# Altium schematic sheet MB1379.SchDoc: Camera Module :HDF5640-AF-V2.0
size A4; Date: Not used; ApprovedBy: Not used; CheckedBy: Not used; Author: Not used; CompanyName: STMicroelectronics; DrawnBy: Not used; Engineer: Not used; Organization: Not used; Address1: Not used; Address2: Not used; Address3: Not used; Address4: Not used; DocumentNumber: Not used; Revision: Not used; SheetNumber: 2; SheetTotal: 2; CurrentTime: Not used; CurrentDate: Not used; Time: Not used; DocumentFullPathAndName: Not used; DocumentName: Not used; ModifiedDate: Not used; ImagePath: Not used; ProjectName: MB1379; Application_BuildNumber: Not used
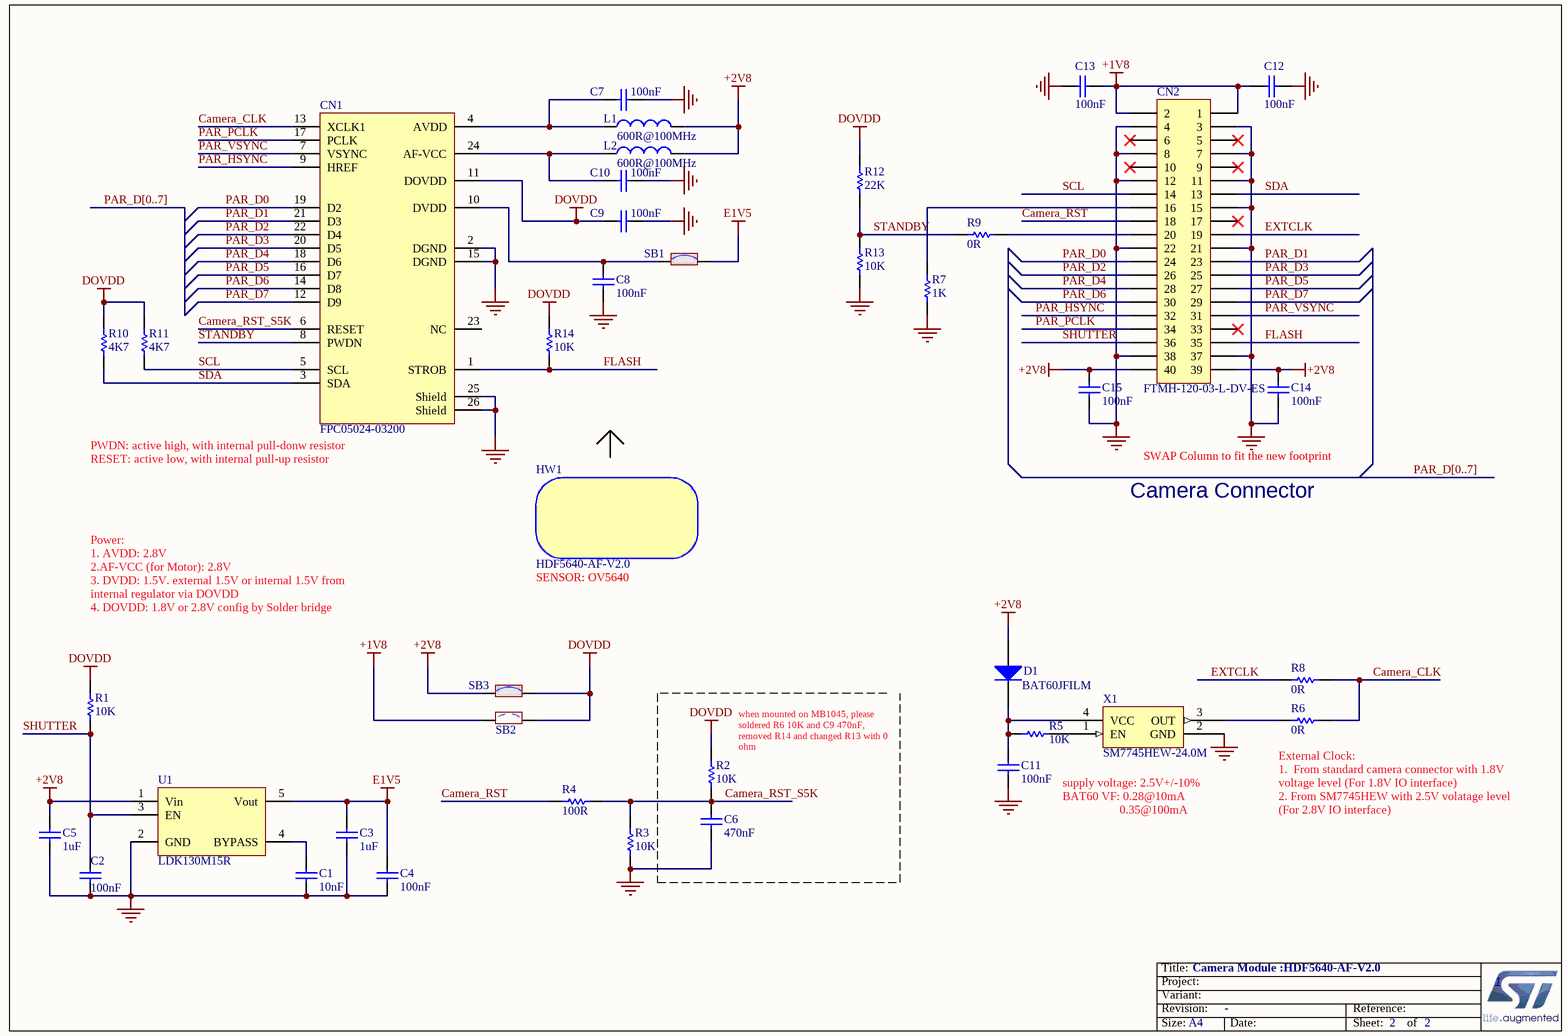
[diagram p0: MB1379.SchDoc]

## Parts
C1  value 10nF  [C0603]  (hidden comment: Capacitor)
C2  value 100nF  [C0603]  (hidden comment: Capacitor)
C3  value 1uF  [C0603]  (hidden comment: Capacitor)
C4  value 100nF  [C0603]  (hidden comment: Capacitor)
C5  value 1uF  [C0603]  (hidden comment: Capacitor)
C6  value 470nF  [C0603]  (hidden comment: Capacitor)
C7  value 100nF  [C0603]  (hidden comment: Capacitor)
C8  value 100nF  [C0603]  (hidden comment: Capacitor)
C9  value 100nF  [C0603]  (hidden comment: Capacitor)
C10  value 100nF  [C0603]  (hidden comment: Capacitor)
C11  value 100nF  [C0603]  (hidden comment: Capacitor)
C12  value 100nF  [C0603]  (hidden comment: Capacitor)
C13  value 100nF  [C0603]  (hidden comment: Capacitor)
C14  value 100nF  [C0603]  (hidden comment: Capacitor)
C15  value 100nF  [C0603]  (hidden comment: Capacitor)
CN1  FPC05024-03200  [CON_ATOM_FPC05024-03200]
CN2  value FTMH-120-03-L-DV-ES  [CON_SAMTEC_FTMH-120-03-L-DV-ES]  (hidden comment: Header 20x2)
D1  BAT60JFILM  [DIO_SOD323]
HW1  value HDF5640-AF-V2.0  (hidden comment: Camera_Module)
L1  value 600R@100MHz  [L0603]  (hidden comment: BEAD)
L2  value 600R@100MHz  [L0603]  (hidden comment: BEAD)
R1  value 10K  [R0603]  (hidden comment: Resistor)
R2  value 10K  [R0603]  (hidden comment: Resistor)
R3  value 10K  [R0603]  (hidden comment: Resistor)
R4  value 100R  [R0603]  (hidden comment: Resistor)
R5  value 10K  [R0603]  (hidden comment: Resistor)
R6  value 0R  [R0603]  (hidden comment: Resistor)
R7  value 1K  [R0603]  (hidden comment: Resistor)
R8  value 0R  [R0603]  (hidden comment: Resistor)
R9  value 0R  [R0603]  (hidden comment: Resistor)
R10  value 4K7  [R0603]  (hidden comment: Resistor)
R11  value 4K7  [R0603]  (hidden comment: Resistor)
R12  value 22K  [R0603]  (hidden comment: Resistor)
R13  value 10K  [R0603]  (hidden comment: Resistor)
R14  value 10K  [R0603]  (hidden comment: Resistor)
SB1  SB_ON  [SOLDER-BRIDGE_R0603-0R]  (value not drawn)
SB2  SB_OFF  [SOLDER-BRIDGE_R0603-0R]  (value not drawn)
SB3  SB_ON  [SOLDER-BRIDGE_R0603-0R]  (value not drawn)
U1  LDK130M15R  [REG_SOT23-5L]
X1  value SM7745HEW-24.0M  [OSC_PLE_SM77H-SERIES_7X5_H1P73_4P]  (hidden comment: SM7745HEV-24.0M)

## Nets
+1V8: C12.1 C13.2 CN2.1 CN2.2 SB2.1
+2V8: C5.2 C14.2 C15.2 CN2.39 CN2.40 D1.1(A) L1.2 L2.2 SB3.1 U1.1(Vin)
DOVDD: C9.1 CN1.11(DOVDD) R1.2 R2.2 R10.1 R11.1 R12.2 R14.2 SB2.2 SB3.2
E1V5: C3.2 C4.2 SB1.2 U1.5(Vout)
GND: C1.1 C2.1 C3.1 C4.1 C5.1 C6.1 C7.2 C8.1 C9.2 C10.2 C11.1 C12.2 C13.1 C14.1 C15.1 CN1.2(DGND) CN1.15(DGND) CN1.25(Shield) CN1.26(Shield) CN2.3 CN2.4 CN2.7 CN2.8 CN2.11 CN2.12 CN2.15 CN2.21 CN2.22 CN2.37 CN2.38 R3.1 R7.2 R13.1 U1.2(GND) X1.2(GND)
Camera_CLK: CN1.13(XCLK1) R6.2 R8.2
Camera_RST: CN2.18 R4.1
Camera_RST_S5K: C6.2 CN1.6(RESET) R2.1 R3.2 R4.2
EXTCLK: CN2.19 R8.1
FLASH: CN1.1(STROB) CN2.35 R14.1
PAR_D0: CN1.19(D2) CN2.24
PAR_D1: CN1.21(D3) CN2.23
PAR_D2: CN1.22(D4) CN2.26
PAR_D3: CN1.20(D5) CN2.25
PAR_D4: CN1.18(D6) CN2.28
PAR_D5: CN1.16(D7) CN2.27
PAR_D6: CN1.14(D8) CN2.30
PAR_D7: CN1.12(D9) CN2.29
PAR_HSYNC: CN1.9(HREF) CN2.32
PAR_PCLK: CN1.17(PCLK) CN2.34
PAR_VSYNC: CN1.7(VSYNC) CN2.31
SCL: CN1.5(SCL) CN2.14 R11.2
SDA: CN1.3(SDA) CN2.13 R10.2
SHUTTER: C2.2 CN2.36 R1.1 U1.3(EN)
STANDBY: CN1.8(PWDN) R9.1 R12.1 R13.2
NetC1_2: C1.2 U1.4(BYPASS)
NetC7_1: C7.1 CN1.4(AVDD) L1.1
NetC8_2: C8.2 CN1.10(DVDD) SB1.1
NetC10_1: C10.1 CN1.24(AF-VCC) L2.1
NetC11_2: C11.2 D1.2(K) R5.2 X1.4(VCC)
NetCN2_16: CN2.16 R7.1
NetCN2_20: CN2.20 R9.2
NetR5_1: R5.1 X1.1(EN)
NetR6_1: R6.1 X1.3(OUT)

Not connected (* = marked no-connect by the designer): CN1 23(NC); CN2 5* 6* 9* 10* 17* 33*

## Buses and harness runs
bus PAR_D[0..7]

## Notes on the sheet
- (near CN1) PWDN: active high, with internal pull-donw resistor
  RESET: active low, with internal pull-up resistor
- Camera Connector
- SWAP Column to fit the new footprint
- SENSOR: OV5640
- Power:
  1. AVDD: 2.8V
  2.AF-VCC (for Motor): 2.8V
  3. DVDD: 1.5V. external 1.5V or internal 1.5V from internal regulator via DOVDD
  4. DOVDD: 1.8V or 2.8V config by Solder bridge
- (near R2) when mounted on MB1045, please soldered R6 10K and C9 470nF, removed R14 and changed R13 with 0 ohm
- supply voltage: 2.5V+/-10%
  BAT60 VF: 0.28@10mA
  0.35@100mA
- (near R6) External Clock:
  1.  From standard camera connector with 1.8V voltage level (For 1.8V IO interface)
  2. From SM7745HEW with 2.5V volatage level (For 2.8V IO interface)
- 1
- Title:
- Project:
- Size:
- Revision:
- Variant:
- A4
- -
- Date:
- Reference:
- Sheet:
- of

## Library data of the parts
C1 = MCD-01007: Capacitor, MLCC, 10nF, 16V, X7R, 10%, 0603, T=0.8mm; Manufacturer_Part_Number: CC0603KRX7R7BB103; Manufacturer: YAGEO; Provided_By: SUBCO; Internal_Part_Number: MCD-01007; ECCN_US: N/A; ECCN_EU: N/A; ComponentLink1Description: Datasheet; Status: Released; Part_Type: Capacitor; Package: C0603; ComponentLink1URL: http://tunmcdsvn.tun.st.com/Component_Datasheet_Library/Trunk/Capacitors/Yageo_Multilayer_Capacitor_X7R_series_100pF_to_22uF/
C2 C4 C7-C15 = MCD-00211: Capacitor, MLCC, 100nF, 16V, X7R, 10%, 0603, T=0,8mm; Manufacturer_Part_Number: CC0603KRX7R7BB104; Manufacturer: YAGEO; ECCN_US: EAR99; ECCN_EU: NEC; Provided_By: SUBCO; Internal_Part_Number: MCD-00211; ComponentLink1Description: Datasheet; Status: Released; Part_Type: Capacitor; Package: C0603; ComponentLink1URL: http://tunmcdsvn.tun.st.com/Component_Datasheet_Library/Trunk/Capacitors/Yageo_Multilayer_Capacitor_X7R_series_100pF_to_22uF
C3 C5 = MCD-00010: Capacitor, MLCC, 1uF, 16V, X5R, 10%, 0603, T=0,8mm; Manufacturer_Part_Number: CC0603KRX5R7BB105; Manufacturer: YAGEO; ECCN_US: EAR99; ECCN_EU: NEC; Provided_By: SUBCO; Internal_Part_Number: MCD-00010; ComponentLink1Description: Datasheet; Status: Released; Part_Type: Capacitor; Package: C0603; ComponentLink1URL: http://tunmcdsvn.tun.st.com/Component_Datasheet_Library/Trunk/Capacitors/Yageo_Multilayer_capacitor_X5R_series_100pF_to_100uF
C6 = MCD-01006: Capacitor, MLCC, 470nF, 16V, X7R, 10%, 0603, T=0.8mm; Manufacturer_Part_Number: CC0603KRX7R7BB474; Manufacturer: YAGEO; Provided_By: SUBCO; Internal_Part_Number: MCD-01006; Status: Released; Part_Type: Capacitor; Package: C0603; ComponentLink1Description: Datasheet; ComponentLink1URL: http://tunmcdsvn.tun.st.com/Component_Datasheet_Library/Trunk/Capacitors/Yageo_Multilayer_Capacitor_X7R_series_100pF_to_22uF/; ECCN_US: N/A; ECCN_EU: N/A
CN1 = MCD-01009: FFC/FPC ZIF Connector - 0.5mm, 24 pins, Upper Contacts; Manufacturer: ATOM; Provided_By: SUBCO; Internal_Part_Number: MCD-01009; Value: FPC05024-03200; Status: Released; Part_Type: Connector; Manufacturer_Part_Number: FPC05024-03200; ComponentLink1Description: Datasheet; ComponentLink1URL: http://tunmcdsvn.tun.st.com/Component_Datasheet_Library/Trunk/Connectors/ATOM_Connector_FPC05024-03200; ECCN_US: n/a; ECCN_EU: n/a
CN2 = MCD-01010: Header 20x2, 1mm, Dual Vertical,SMT,End Shroud,Height 3.25mm; Part_Type: Connector; Manufacturer: SAMTEC; Provided_By: SUBCO; Internal_Part_Number: MCD-01010; Status: Released; Manufacturer_Part_Number: FTMH-120-03-L-DV-ES; ComponentLink1Description: Datasheet; ComponentLink1URL: http://tunmcdsvn.tun.st.com/Component_Datasheet_Library/Trunk/Connectors/Samtec_FTMH_SM; ECCN_US: n/a; ECCN_EU: n/a
D1 = MCD-00034: Manufacturer: STMICROELECTRONICS; Part_Type: Diode; BMS_Part_Number: 9151097; ECCN_US: EAR99; ECCN_EU: NEC; Provided_By: SUBCO with ST control; Internal_Part_Number: MCD-00034; Value: BAT60JFILM; Manufacturer_Part_Number: BAT60JFILM; ComponentLink1Description: Datasheet; Status: Released; ComponentLink1URL: http://tunmcdsvn.tun.st.com/Component_Datasheet_Library/Trunk/Diodes/STM_Diode_BAT60JFILM-SOD323
HW1 = MCD-01012: Camera Module with OV5640; Part_Type: Misc; Manufacturer: SHENZHEN V-VISION TECHNOLOGY CO. LTD; Alternate_Manufacturer: OEM; Provided_By: SUBCO; Internal_Part_Number: MCD-01012; Status: Released; Manufacturer_Part_Number: HDF5640-AF-V2.0; ComponentLink1Description: Datasheet; ComponentLink1URL: http://tunmcdsvn.tun.st.com/Component_Datasheet_Library/Trunk/Misc/CMOSCAMERA_CameraModule_HDF5640-AF-V2.0.pdf/; ECCN_US: n/a; ECCN_EU: n/a
L1 L2 = MCD-00047: SMD Chip ferrite bead, 600R@100MHz +/-25%, 350mA, 500mohm DC, 0603, T=0.8mm; Part_Type: Inductor; Manufacturer_Part_Number: FCM1608KF-601T03; Manufacturer: TAI-TECH; Provided_By: SUBCO; Internal_Part_Number: MCD-00047; Status: Released; ComponentLink1Description: Datasheet; ComponentLink1URL: http://tunmcdsvn.tun.st.com/Component_Datasheet_Library/Trunk/Inductors/TaiTech_Bead_FCM1608_series; ECCN_US: n/a; ECCN_EU: n/a
R1-R3 R5 R13 R14 = MCD-00220: Resistor,10K,0603,1%,1/10W; Manufacturer_Part_Number: RC0603FR-0710KL; Manufacturer: YAGEO; ECCN_US: EAR99; ECCN_EU: NEC; Provided_By: SUBCO; Internal_Part_Number: MCD-00220; Status: Released; Part_Type: Resistor; Package: R0603; ComponentLink1Description: Datasheet; ComponentLink1URL: http://tunmcdsvn.tun.st.com/Component_Datasheet_Library/Trunk/Resistors/Yageo_Resistor_RC0603-series
R4 = MCD-00224: Resistor,100R,0603,1%,1/10W; Manufacturer_Part_Number: RC0603FR-07100RL; Manufacturer: YAGEO; Alternate_Manufacturer_Part_Number: RT0402FRE07100KL; Part_Preference: Recommended; ECCN_US: EAR99; ECCN_EU: NEC; Provided_By: SUBCO; Internal_Part_Number: MCD-00224; Status: Released; Part_Type: Resistor; Alternate_Manufacturer: YAGEO; Package: R0603; ComponentLink1Description: Datasheet; ComponentLink1URL: http://tunmcdsvn.tun.st.com/Component_Datasheet_Library/Trunk/Resistors/Yageo_Resistor_RC0603-series; Order_Code_Digikey: 311-100HRCT-ND; Order_Code_Farnell: 9238360; Order_Code_RS: N/A
R6 R8 R9 = MCD-00056: Resistor,0R,0603,5%,1/10W; Manufacturer_Part_Number: RC0603JR-070RL; Manufacturer: YAGEO; ECCN_US: EAR99; ECCN_EU: NEC; Provided_By: SUBCO; Internal_Part_Number: MCD-00056; Status: Released; Part_Type: Resistor; Package: R0603; ComponentLink1Description: Datasheet; ComponentLink1URL: http://tunmcdsvn.tun.st.com/Component_Datasheet_Library/Trunk/Resistors/Yageo_Resistor_RC0603-series
R7 = MCD-00070: Resistor,1K,0603,1%,1/10W; Manufacturer_Part_Number: RC0603FR-071KL; Manufacturer: YAGEO; Alternate_Manufacturer_Part_Number: RT0402FRE07100KL; ECCN_US: EAR99; ECCN_EU: NEC; Provided_By: SUBCO; Internal_Part_Number: MCD-00070; Status: Released; Part_Type: Resistor; Alternate_Manufacturer: YAGEO; Package: R0603; ComponentLink1Description: Datasheet; ComponentLink1URL: http://tunmcdsvn.tun.st.com/Component_Datasheet_Library/Trunk/Resistors/Yageo_Resistor_RC0603-series; Order_Code_Digikey: 311-1.00KHRCT-ND; Order_Code_Farnell: 9238484RL; Order_Code_RS: N/A
R10 R11 = MCD-00219: Resistor,4K7,0603,1%,1/10W; Manufacturer_Part_Number: RC0603FR-074K7L; Manufacturer: YAGEO; ECCN_US: EAR99; ECCN_EU: NEC; Provided_By: SUBCO; Internal_Part_Number: MCD-00219; Status: Released; Part_Type: Resistor; Package: R0603; ComponentLink1Description: Datasheet; ComponentLink1URL: http://tunmcdsvn.tun.st.com/Component_Datasheet_Library/Trunk/Resistors/Yageo_Resistor_RC0603-series
R12 = MCD-00430: Resistor,22K,0603,1%,1/10W; Manufacturer_Part_Number: RC0603FR-0722KL; Manufacturer: YAGEO; ECCN_US: EAR99; ECCN_EU: NEC; Provided_By: SUBCO; Internal_Part_Number: MCD-00430; Status: Released; Part_Type: Resistor; Package: R0603; ComponentLink1Description: Datasheet; ComponentLink1URL: http://tunmcdsvn.tun.st.com/Component_Datasheet_Library/Trunk/Resistors/Yageo_Resistor_RC0603-series
SB1 SB3 = MCD-00071: Solder Bridge ON; Part_Type: Mechanical; Manufacturer: YAGEO; Manufacturer_Part_Number: RC0603JR-070RL; Provided_By: SUBCO; Internal_Part_Number: MCD-00071; ECCN_US: n/a; ECCN_EU: n/a; Status: Released; ComponentLink1Description: Datasheet; ComponentLink1URL: http://tunmcdsvn.tun.st.com/Component_Datasheet_Library/Trunk/Resistors/Yageo_Resistor_RC0603-series; Package: SB0603
SB2 = MCD-00072: Solder Bridge OFF; Part_Type: Mechanical; Manufacturer: YAGEO; Manufacturer_Part_Number: RC0603JR-070RL; Provided_By: SUBCO; Internal_Part_Number: MCD-00072; Status: Released; ECCN_US: n/a; ECCN_EU: n/a; ComponentLink1Description: Datasheet; ComponentLink1URL: http://tunmcdsvn.tun.st.com/Component_Datasheet_Library/Trunk/Resistors/Yageo_Resistor_RC0603-series; Package: SB0603
U1 = MCD-01008: LDO - 300 mA low quiescent current - very low noise; Part_Type: IC; Manufacturer: STMICROELECTRONICS; ECCN_US: EAR99; ECCN_EU: NEC; Provided_By: SUBCO with ST control; Internal_Part_Number: MCD-01008; Value: LDK130M15R; Status: Released; Manufacturer_Part_Number: LDK130M15R; Package: SOT23-5L; ComponentLink1Description: Datasheet; ComponentLink1URL: http://tunmcdsvn.tun.st.com/Component_Datasheet_Library/Trunk/IC/STM_LDO_LDK130M15R
X1 = MCD-01011: SM77H Series 2.5V  CMOS 24MHz Clock Oscillator; Part_Type: Crystal_Osc; Manufacturer: PLETRONICS; Provided_By: SUBCO; Internal_Part_Number: MCD-01011; Status: Released; Manufacturer_Part_Number: SM7745HEW-24.0M; ComponentLink1Description: Datasheet; ComponentLink1URL: http://tunmcdsvn.tun.st.com/Component_Datasheet_Library/Trunk/Crystal_Osc/Pletronics_quartz_sm77hseries_SM7745HEW-24.00M 2.5v; ECCN_US: n/a; ECCN_EU: n/a